# EasyEDA Pro project H7MS-H735-R4B-final-20261017.epro, schematic H7MS_CORE_H735_A1_核心板原理图, sheet 11 of 11

## Sheets
11 C10_XT30宽压输入与5V电源: Board Name: CORE_H735核心板; Create Date: 2026-10-17; Schematic Name: H7MS_CORE_H735_A1_核心板原理图; Update Date: 2026-10-17; Page Size: A4; Version: V1.0
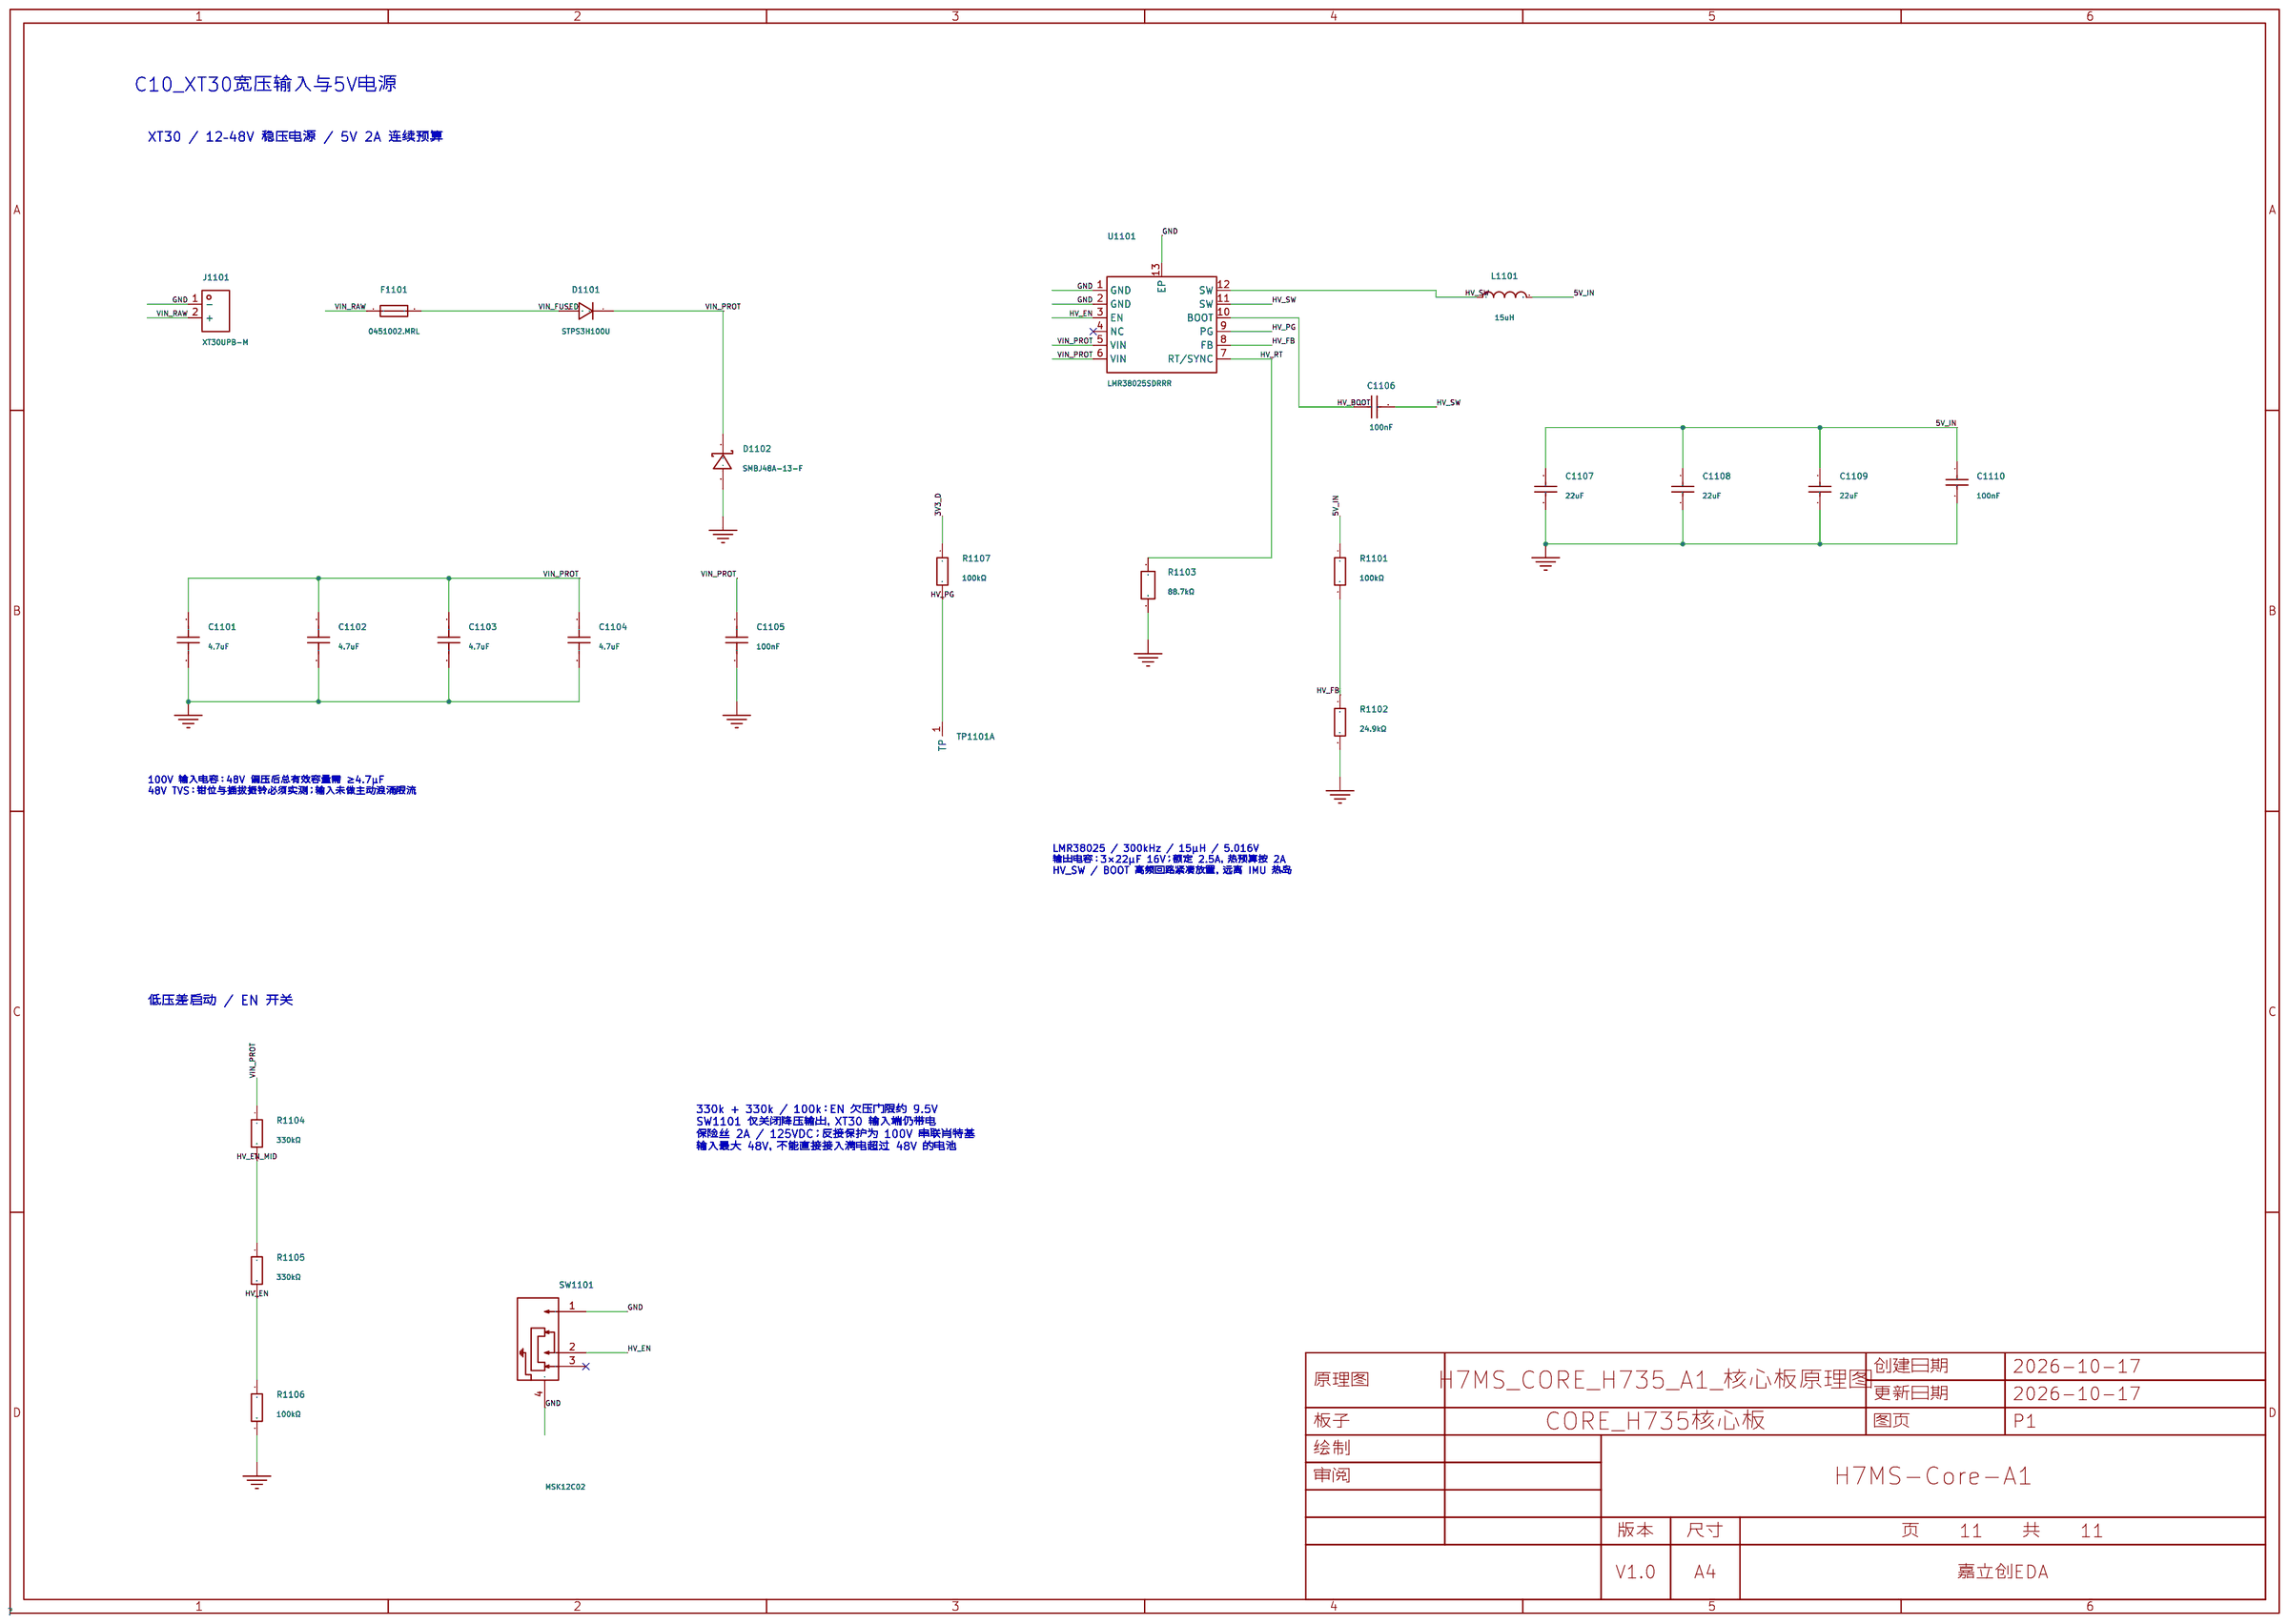
[diagram p10: C10_XT30宽压输入与5V电源]

## Parts
C1101  4.7uF  [C1210]
C1102  4.7uF  [C1210]
C1103  4.7uF  [C1210]
C1104  4.7uF  [C1210]
C1105  100nF  [C0603]
C1106  100nF  [C0402]
C1107  22uF  [C1206]
C1108  22uF  [C1206]
C1109  22uF  [C1206]
C1110  100nF  [C0402]
D1101  STPS3H100U  [SMB_L4.6-W3.6-LS5.3-RD]
D1102  SMBJ48A-13-F  [SMB_L4.6-W3.6-LS5.3-RD]
F1101  0451002.MRL  [FUSE-SMD_L6.1-W2.7_0451002.MRL]
J1101  XT30UPB-M  [H7MS_XT30UPB_M_Drill1p90]
L1101  15uH  [IND-SMD_L6.6-W6.4_XAL6060-103ME]
R1101  100kΩ  [R0402]
R1102  24.9kΩ  [R0402]
R1103  88.7kΩ  [R0402]
R1104  330kΩ  [R0402]
R1105  330kΩ  [R0402]
R1106  100kΩ  [R0402]
R1107  100kΩ  [R0402]
SW1101  MSK12C02  [SW-TH_MSK12C02]
TP1101  -  [H7MS_TP_0p8_NOMASKPASTE]  (section 1)
U1101  LMR38025SDRRR  [WSON-12_L3.0-W3.0-P0.50-TL-EP-2]

## Library data of the parts
C1101 = GRM32ER72A475KE14L: 容值:4.7uF;精度:±10%;额定电压:100V;温度系数:X7R;; LCSC Part Name: 4.7uF ±10% 100V; Supplier Part: C162515; Manufacturer: muRata(村田); Supplier Footprint: 1210; JLCPCB Part Class: Extended Part; Datasheet: https://item.szlcsc.com/datasheet/GRM32ER72A475KE14L/173896.html; Supplier: LCSC; Tolerance: ±10%; Voltage Rating: 100V; Temperature Coefficient: X7R; H7MS_Function: C_HV_IN1; H7MS_Revision: R4; H7MS_Assembly: FIT
C1102 = GRM32ER72A475KE14L: 容值:4.7uF;精度:±10%;额定电压:100V;温度系数:X7R;; LCSC Part Name: 4.7uF ±10% 100V; Supplier Part: C162515; Manufacturer: muRata(村田); Supplier Footprint: 1210; JLCPCB Part Class: Extended Part; Datasheet: https://item.szlcsc.com/datasheet/GRM32ER72A475KE14L/173896.html; Supplier: LCSC; Tolerance: ±10%; Voltage Rating: 100V; Temperature Coefficient: X7R; H7MS_Function: C_HV_IN2; H7MS_Revision: R4; H7MS_Assembly: FIT
C1103 = GRM32ER72A475KE14L: 容值:4.7uF;精度:±10%;额定电压:100V;温度系数:X7R;; LCSC Part Name: 4.7uF ±10% 100V; Supplier Part: C162515; Manufacturer: muRata(村田); Supplier Footprint: 1210; JLCPCB Part Class: Extended Part; Datasheet: https://item.szlcsc.com/datasheet/GRM32ER72A475KE14L/173896.html; Supplier: LCSC; Tolerance: ±10%; Voltage Rating: 100V; Temperature Coefficient: X7R; H7MS_Function: C_HV_IN3; H7MS_Revision: R4; H7MS_Assembly: FIT
C1104 = GRM32ER72A475KE14L: 容值:4.7uF;精度:±10%;额定电压:100V;温度系数:X7R;; LCSC Part Name: 4.7uF ±10% 100V; Supplier Part: C162515; Manufacturer: muRata(村田); Supplier Footprint: 1210; JLCPCB Part Class: Extended Part; Datasheet: https://item.szlcsc.com/datasheet/GRM32ER72A475KE14L/173896.html; Supplier: LCSC; Tolerance: ±10%; Voltage Rating: 100V; Temperature Coefficient: X7R; H7MS_Function: C_HV_IN4; H7MS_Revision: R4; H7MS_Assembly: FIT
C1105 = GRM188R72A104KA35D: 容值:100nF;精度:±10%;额定电压:100V;温度系数:X7R;; LCSC Part Name: 100nF ±10% 100V; Supplier Part: C77058; Manufacturer: muRata(村田); Supplier Footprint: 0603; JLCPCB Part Class: Extended Part; Datasheet: https://item.szlcsc.com/datasheet/GRM188R72A104KA35D/78185.html; Supplier: LCSC; Tolerance: ±10%; Voltage Rating: 100V; Temperature Coefficient: X7R; H7MS_Function: C_HV_HF; H7MS_Revision: R4; H7MS_Assembly: FIT
C1106 = C1005X7R1H104K050BB: 容值:100nF;精度:±10%;额定电压:50V;温度系数:X7R;; LCSC Part Name: 100nF ±10% 50V; Supplier Part: C2181015; Manufacturer: TDK; Supplier Footprint: 0402; JLCPCB Part Class: Extended Part; Datasheet: https://item.szlcsc.com/datasheet/C1005X7R1H104K050BB/2273082.html; Supplier: LCSC; Tolerance: ±10%; Voltage Rating: 50V; Temperature Coefficient: X7R; H7MS_Function: C_HV_BOOT; H7MS_Revision: R4; H7MS_Assembly: FIT
C1107 = GRM31CR61C226KE15L: 容值:22uF;精度:±10%;额定电压:16V;温度系数:X5R;; LCSC Part Name: 22uF ±10% 16V 停产; Supplier Part: C77088; Manufacturer: muRata(村田); Supplier Footprint: 1206; JLCPCB Part Class: Extended Part; Datasheet: https://item.szlcsc.com/datasheet/GRM31CR61C226KE15L/78215.html; Supplier: LCSC; Tolerance: ±10%; Voltage Rating: 16V; Temperature Coefficient: X5R; H7MS_Function: C_HV_OUT1; H7MS_Revision: R4; H7MS_Assembly: FIT
C1108 = GRM31CR61C226KE15L: 容值:22uF;精度:±10%;额定电压:16V;温度系数:X5R;; LCSC Part Name: 22uF ±10% 16V 停产; Supplier Part: C77088; Manufacturer: muRata(村田); Supplier Footprint: 1206; JLCPCB Part Class: Extended Part; Datasheet: https://item.szlcsc.com/datasheet/GRM31CR61C226KE15L/78215.html; Supplier: LCSC; Tolerance: ±10%; Voltage Rating: 16V; Temperature Coefficient: X5R; H7MS_Function: C_HV_OUT2; H7MS_Revision: R4; H7MS_Assembly: FIT
C1109 = GRM31CR61C226KE15L: 容值:22uF;精度:±10%;额定电压:16V;温度系数:X5R;; LCSC Part Name: 22uF ±10% 16V 停产; Supplier Part: C77088; Manufacturer: muRata(村田); Supplier Footprint: 1206; JLCPCB Part Class: Extended Part; Datasheet: https://item.szlcsc.com/datasheet/GRM31CR61C226KE15L/78215.html; Supplier: LCSC; Tolerance: ±10%; Voltage Rating: 16V; Temperature Coefficient: X5R; H7MS_Function: C_HV_OUT3; H7MS_Revision: R4; H7MS_Assembly: FIT
C1110 = C1005X7R1H104K050BB: 容值:100nF;精度:±10%;额定电压:50V;温度系数:X7R;; LCSC Part Name: 100nF ±10% 50V; Supplier Part: C2181015; Manufacturer: TDK; Supplier Footprint: 0402; JLCPCB Part Class: Extended Part; Datasheet: https://item.szlcsc.com/datasheet/C1005X7R1H104K050BB/2273082.html; Supplier: LCSC; Tolerance: ±10%; Voltage Rating: 50V; Temperature Coefficient: X7R; H7MS_Function: C_HV_OUT_HF; H7MS_Revision: R4; H7MS_Assembly: FIT
D1101 = STPS3H100U: 二极管配置:1个独立式;正向压降(Vf):840mV@3A;直流反向耐压(Vr):100V;整流电流:3A;; LCSC Part Name: 电压:100V 电流:3A; Supplier Part: C283521; Manufacturer: ST(意法半导体); Supplier Footprint: SMB; JLCPCB Part Class: Extended Part; Datasheet: https://item.szlcsc.com/datasheet/STPS3H100U/269331.html; Supplier: LCSC; Diode Configuration: 1个独立式; Voltage - Forward(Vf@If): 840mV@3A; Voltage - DC Reverse(Vr): 100V; Current - Rectified: 3A; Reverse Leakage Current (Ir): 1uA@100V; Non-Repetitive Peak Forward Surge Current: 75A; H7MS_Function: D_REVERSE; H7MS_Revision: R4; H7MS_Assembly: FIT
D1102 = SMBJ48A-13-F: 极性:单向;反向截止电压(Vrwm):48V;钳位电压:77.4V;峰值脉冲电流(Ipp):7.7A@8/20us;峰值脉冲功率(Ppp):600W;击穿电压(VBR):61.3V;; LCSC Part Name: 单向TVS 48V截止 峰值浪涌电流：7.7A@8/20us; Supplier Part: C135078; Manufacturer: DIODES(美台); Supplier Footprint: SMB; JLCPCB Part Class: Extended Part; Datasheet: https://item.szlcsc.com/datasheet/SMBJ48A-13-F/146388.html; Supplier: LCSC; Polarity: 单向; Reverse Stand-Off Voltage (Vrwm): 48V; Clamping Voltage: 77.4V; Peak Pulse Current (Ipp): 7.7A@8/20us; Peak Pulse Power Dissipation (Ppp): 600W; Voltage - Breakdown: 61.3V; Reverse Leakage Current (Ir): 5uA; Number of Channels: 单路; Operating Temperature: -55℃~+150℃; Type: TVS; H7MS_Function: D_INPUT_TVS; H7MS_Revision: R4; H7MS_Assembly: FIT
F1101 = 0451002.MRL: 类型:贴片式保险丝;额定电流:2A;额定电压:125V;分断能力:50A;; LCSC Part Name: 125V贴片式保险丝; Supplier Part: C99547; Manufacturer: Littelfuse(美国力特); Supplier Footprint: 2410; JLCPCB Part Class: Extended Part; Datasheet: https://item.szlcsc.com/datasheet/0451002.MRL/100761.html; Supplier: LCSC; Type: 贴片式保险丝; Current Rating: 2A; Voltage Rating (DC): 125V; Operating Temperature: -55℃~+125℃; Melting I2t: 0.53; Interrupt Rating: 50A; Length: 6.1mm; Width: 2.5mm; H7MS_Function: F_INPUT; H7MS_Revision: R4; H7MS_Assembly: FIT
J1101 = H7MS_XT30UPB_M_Drill1p90: Official copper diameter 2.50 mm and 5.00 mm pitch retained; drill 1.80 -> 1.90 mm. Straight body/silk edges retained; decorative arcs omitted. No PTH stencil openings.; Manufacturer: AMASS(艾迈斯); Supplier: LCSC; Supplier Part: C428721; LCSC Part Name: AMASS(艾迈斯)板载立式 航模锂电池控制器连接器插头 PCB板立式 公头XT30UPB-M.G.Y; JLCPCB Part Class: Extended Part; Datasheet: https://item.szlcsc.com/datasheet/XT30UPB-M/423831.html; Rated current: 15A; Rated voltage: 500VDC; colour: 黄色; Connector type: 航模插头; contact resistance: 0.65mΩ; interface form: 公头; insulating material: PA; metal material: 镀金; H7MS_Function: J_XT30; H7MS_Revision: R4; H7MS_Assembly: FIT
L1101 = XAL6060-153MEC: 电感值:15uH;精度:±20%;额定电流:4.5A;饱和电流(Isat):5.8A;; LCSC Part Name: AEC-Q200; Supplier Part: C19191628; Manufacturer: Coilcraft(线艺); Supplier Footprint: SMD,6.5x6.3mm; JLCPCB Part Class: Extended Part; Datasheet: https://www.coilcraft.com/getmedia/ea51f14b-7f32-4dc6-8dfe-d4b70549040f/xal60xx.pdf; Supplier: LCSC; Tolerance: ±20%; Current Rating: 4.5A; Current - Saturation(Isat): 5.8A; DC Resistance(DCR): 39.77mΩ; H7MS_Function: L_HV; H7MS_Revision: R4; H7MS_Assembly: FIT
R1101 = RC0402FR-07100KL: 电阻类型:厚膜电阻;阻值:100kΩ;精度:±1%;功率:62.5mW;工作电压:50V;温度系数:±100ppm/℃;; LCSC Part Name: 厚膜电阻 100kΩ ±1% 62.5mW; Supplier Part: C60491; Manufacturer: YAGEO(国巨); Supplier Footprint: 0402; JLCPCB Part Class: Extended Part; Datasheet: https://item.szlcsc.com/datasheet/RC0402FR-07100KL/61543.html; Supplier: LCSC; Type: 厚膜电阻; Tolerance: ±1%; Power(Watts): 62.5mW; Voltage-Supply(Max): 50V; Temperature Coefficient: ±100ppm/℃; Operating Temperature: -55℃~+155℃; H7MS_Function: R_HV_FB_TOP; H7MS_Revision: R4; H7MS_Assembly: FIT
R1102 = RC0402FR-0724K9L: 电阻类型:厚膜电阻;阻值:24.9kΩ;精度:±1%;功率:62.5mW;工作电压:50V;温度系数:±100ppm/℃;; LCSC Part Name: 厚膜电阻 24.9kΩ ±1% 62.5mW; Supplier Part: C138027; Manufacturer: YAGEO(国巨); Supplier Footprint: 0402; JLCPCB Part Class: Extended Part; Datasheet: https://item.szlcsc.com/datasheet/RC0402FR-0724K9L/149343.html; Supplier: LCSC; Type: 厚膜电阻; Tolerance: ±1%; Power(Watts): 62.5mW; Voltage-Supply(Max): 50V; Temperature Coefficient: ±100ppm/℃; Operating Temperature: -55℃~+155℃; H7MS_Function: R_HV_FB_BOT; H7MS_Revision: R4; H7MS_Assembly: FIT
R1103 = RC0402FR-0788K7L: 电阻类型:厚膜电阻;阻值:88.7kΩ;精度:±1%;功率:62.5mW;最大工作电压:50V;温度系数:±100ppm/℃;; LCSC Part Name: 厚膜电阻 88.7kΩ ±1% 62.5mW; Supplier Part: C477808; Manufacturer: YAGEO(国巨); Supplier Footprint: 0402; JLCPCB Part Class: Extended Part; Datasheet: https://atta.szlcsc.com/upload/public/pdf/source/20200715/C477808_E93B983CCCA2234B6CC6C85034F2A362.pdf; Supplier: LCSC; Type: 厚膜电阻; Tolerance: ±1%; Power(Watts): 62.5mW; Overload Voltage (Max): 50V; Temperature Coefficient: ±100ppm/℃; Operating Temperature Range: -55℃~+155℃; H7MS_Function: R_HV_RT; H7MS_Revision: R4; H7MS_Assembly: FIT
R1104 = RC0402FR-07330KL: 电阻类型:厚膜电阻;阻值:330kΩ;精度:±1%;功率:62.5mW;工作电压:50V;温度系数:±100ppm/℃;; LCSC Part Name: 厚膜电阻 330kΩ ±1% 62.5mW; Supplier Part: C138006; Manufacturer: YAGEO(国巨); Supplier Footprint: 0402; JLCPCB Part Class: Extended Part; Datasheet: https://item.szlcsc.com/datasheet/RC0402FR-07330KL/149322.html; Supplier: LCSC; Type: 厚膜电阻; Tolerance: ±1%; Power(Watts): 62.5mW; Voltage-Supply(Max): 50V; Temperature Coefficient: ±100ppm/℃; Operating Temperature: -55℃~+155℃; H7MS_Function: R_HV_EN_TOP1; H7MS_Revision: R4; H7MS_Assembly: FIT
R1105 = RC0402FR-07330KL: 电阻类型:厚膜电阻;阻值:330kΩ;精度:±1%;功率:62.5mW;工作电压:50V;温度系数:±100ppm/℃;; LCSC Part Name: 厚膜电阻 330kΩ ±1% 62.5mW; Supplier Part: C138006; Manufacturer: YAGEO(国巨); Supplier Footprint: 0402; JLCPCB Part Class: Extended Part; Datasheet: https://item.szlcsc.com/datasheet/RC0402FR-07330KL/149322.html; Supplier: LCSC; Type: 厚膜电阻; Tolerance: ±1%; Power(Watts): 62.5mW; Voltage-Supply(Max): 50V; Temperature Coefficient: ±100ppm/℃; Operating Temperature: -55℃~+155℃; H7MS_Function: R_HV_EN_TOP2; H7MS_Revision: R4; H7MS_Assembly: FIT
R1106 = RC0402FR-07100KL: 电阻类型:厚膜电阻;阻值:100kΩ;精度:±1%;功率:62.5mW;工作电压:50V;温度系数:±100ppm/℃;; LCSC Part Name: 厚膜电阻 100kΩ ±1% 62.5mW; Supplier Part: C60491; Manufacturer: YAGEO(国巨); Supplier Footprint: 0402; JLCPCB Part Class: Extended Part; Datasheet: https://item.szlcsc.com/datasheet/RC0402FR-07100KL/61543.html; Supplier: LCSC; Type: 厚膜电阻; Tolerance: ±1%; Power(Watts): 62.5mW; Voltage-Supply(Max): 50V; Temperature Coefficient: ±100ppm/℃; Operating Temperature: -55℃~+155℃; H7MS_Function: R_HV_EN_BOT; H7MS_Revision: R4; H7MS_Assembly: FIT
R1107 = RC0402FR-07100KL: 电阻类型:厚膜电阻;阻值:100kΩ;精度:±1%;功率:62.5mW;工作电压:50V;温度系数:±100ppm/℃;; LCSC Part Name: 厚膜电阻 100kΩ ±1% 62.5mW; Supplier Part: C60491; Manufacturer: YAGEO(国巨); Supplier Footprint: 0402; JLCPCB Part Class: Extended Part; Datasheet: https://item.szlcsc.com/datasheet/RC0402FR-07100KL/61543.html; Supplier: LCSC; Type: 厚膜电阻; Tolerance: ±1%; Power(Watts): 62.5mW; Voltage-Supply(Max): 50V; Temperature Coefficient: ±100ppm/℃; Operating Temperature: -55℃~+155℃; H7MS_Function: R_HV_PG; H7MS_Revision: R4; H7MS_Assembly: FIT
SW1101 = MSK12C02: 电路结构:单刀双掷;安装方式:卧贴;开关颜色:-;额定电流:50mA;额定电压:12V;工作寿命:1万次;; LCSC Part Name: MSK12C02 白柄1.5编带; Supplier Part: C431540; Manufacturer: SHOU HAN(首韩); Supplier Footprint: SMD,8x2.8mm; JLCPCB Part Class: Extended Part; Datasheet: https://item.szlcsc.com/datasheet/MSK12C02/427897.html; Supplier: LCSC; Circuit: 单刀双掷; Termination Style: SMD接片; Length: 8mm; Width: 2.8mm; Switch Height: 1.4mm; Mounting Type: 卧贴; Current Rating: 50mA; Voltage Rating: 12V; Life: 1万次; Operating Temperature: -20℃~+70℃; H7MS_Function: SW_POWER_EN; H7MS_Revision: R4; H7MS_Assembly: FIT
TP1101 = H7MS_PCB_TP_0.8: PCB copper feature, no purchased part; Manufacturer Part: PCB_TP_0.8; H7MS_Function: TP_HV_PG; H7MS_Revision: R4; H7MS_Assembly: FIT
U1101 = LMR38025SDRRR: 功能类型:降压型;工作电压:4.2V~80V;输出电压:1V~75V;输出电流:2.5A;输出类型:可调;; LCSC Part Name: 降压型 2.5A 4.2V~80V; Supplier Part: C22405313; Manufacturer: TI(德州仪器); Supplier Footprint: WSON-12-EP(3x3); JLCPCB Part Class: Extended Part; Datasheet: https://www.ti.com.cn/cn/lit/ds/symlink/lmr38025.pdf; Supplier: LCSC; Function: 降压型; Voltage - Supply: 4.2V~80V; Output Voltage: 1V~75V; Output Current: 2.5A; Frequency - Switching: 200kHz~2.2MHz; Operating Temperature: -40℃~+150℃@(TJ); Synchronous Rectifier: 是; Number of Outputs: 1; Topology: 降压式; Quiescent Current: 40uA; Switch tube (built-in/external): 内置; Output Type: 可调; Features: 轻载高效模式；频率同步；逐波限流；过流保护；EMI优化(抖频模式)；工作状态指示；打嗝限流; H7MS_Function: U_HV; H7MS_Revision: R4; H7MS_Assembly: FIT

## Nets
3V3_D: R1107.1 ; also on sheet 1 2 3 4 5 6 7 8 10
5V_IN: C1107.1 C1108.1 C1109.1 C1110.1 L1101.2 R1101.1 ; also on sheet 3 5 6 8 10
GND: C1101.2 C1102.2 C1103.2 C1104.2 C1105.2 C1107.2 C1108.2 C1109.2 C1110.2 D1102.2(A) J1101.1(-) R1102.2 R1103.2 R1106.2 SW1101.1 SW1101.4 U1101.1(GND) U1101.2(GND) U1101.13(EP) ; also on sheet 1 2 3 4 5 6 7 8 9 10
VIN_FUSED: D1101.2(A) F1101.2
VIN_PROT: C1101.1 C1102.1 C1103.1 C1104.1 C1105.1 D1101.1(K) D1102.1(K) R1104.1 U1101.5(VIN) U1101.6(VIN)
VIN_RAW: F1101.1 J1101.2(+)
HV_BOOT: C1106.1 U1101.10(BOOT)
HV_EN: R1105.2 R1106.1 SW1101.2 U1101.3(EN)
HV_EN_MID: R1104.2 R1105.1
HV_FB: R1101.2 R1102.1 U1101.8(FB)
HV_PG: R1107.2 TP1101.1(TP) U1101.9(PG)
HV_RT: R1103.1 U1101.7(RT/SYNC)
HV_SW: C1106.2 L1101.1 U1101.11(SW) U1101.12(SW)

Not connected (* = marked no-connect by the designer): SW1101 3*; U1101 4(NC)*

## Notes on the sheets
sheet 11
- C10_XT30宽压输入与5V电源
- C10_XT30宽压输入与5V电源
- C10_XT30宽压输入与5V电源
- C10_XT30宽压输入与5V电源
- C10_XT30宽压输入与5V电源
- C10_XT30宽压输入与5V电源
- XT30 / 12–48V 稳压电源 / 5V 2A 连续预算
- XT30 / 12–48V 稳压电源 / 5V 2A 连续预算
- XT30 / 12–48V 稳压电源 / 5V 2A 连续预算
- XT30 / 12–48V 稳压电源 / 5V 2A 连续预算
- XT30 / 12–48V 稳压电源 / 5V 2A 连续预算
- XT30 / 12–48V 稳压电源 / 5V 2A 连续预算
- 100V 输入电容：48V 偏压后总有效容量需 ≥4.7µF
  48V TVS：钳位与插拔振铃必须实测；输入未做主动浪涌限流
- 100V 输入电容：48V 偏压后总有效容量需 ≥4.7µF
  48V TVS：钳位与插拔振铃必须实测；输入未做主动浪涌限流
- 100V 输入电容：48V 偏压后总有效容量需 ≥4.7µF
  48V TVS：钳位与插拔振铃必须实测；输入未做主动浪涌限流
- 100V 输入电容：48V 偏压后总有效容量需 ≥4.7µF
  48V TVS：钳位与插拔振铃必须实测；输入未做主动浪涌限流
- 100V 输入电容：48V 偏压后总有效容量需 ≥4.7µF
  48V TVS：钳位与插拔振铃必须实测；输入未做主动浪涌限流
- 100V 输入电容：48V 偏压后总有效容量需 ≥4.7µF
  48V TVS：钳位与插拔振铃必须实测；输入未做主动浪涌限流
- LMR38025 / 300kHz / 15µH / 5.016V
  输出电容：3×22µF 16V；额定 2.5A，热预算按 2A
  HV_SW / BOOT 高频回路紧凑放置，远离 IMU 热岛
- LMR38025 / 300kHz / 15µH / 5.016V
  输出电容：3×22µF 16V；额定 2.5A，热预算按 2A
  HV_SW / BOOT 高频回路紧凑放置，远离 IMU 热岛
- LMR38025 / 300kHz / 15µH / 5.016V
  输出电容：3×22µF 16V；额定 2.5A，热预算按 2A
  HV_SW / BOOT 高频回路紧凑放置，远离 IMU 热岛
- LMR38025 / 300kHz / 15µH / 5.016V
  输出电容：3×22µF 16V；额定 2.5A，热预算按 2A
  HV_SW / BOOT 高频回路紧凑放置，远离 IMU 热岛
- LMR38025 / 300kHz / 15µH / 5.016V
  输出电容：3×22µF 16V；额定 2.5A，热预算按 2A
  HV_SW / BOOT 高频回路紧凑放置，远离 IMU 热岛
- LMR38025 / 300kHz / 15µH / 5.016V
  输出电容：3×22µF 16V；额定 2.5A，热预算按 2A
  HV_SW / BOOT 高频回路紧凑放置，远离 IMU 热岛
- 低压差启动 / EN 开关
- 低压差启动 / EN 开关
- 低压差启动 / EN 开关
- 低压差启动 / EN 开关
- 低压差启动 / EN 开关
- 低压差启动 / EN 开关
- 330k + 330k / 100k：EN 欠压门限约 9.5V
  SW1101 仅关闭降压输出，XT30 输入端仍带电
  保险丝 2A / 125VDC；反接保护为 100V 串联肖特基
  输入最大 48V，不能直接接入满电超过 48V 的电池
- 330k + 330k / 100k：EN 欠压门限约 9.5V
  SW1101 仅关闭降压输出，XT30 输入端仍带电
  保险丝 2A / 125VDC；反接保护为 100V 串联肖特基
  输入最大 48V，不能直接接入满电超过 48V 的电池
- 330k + 330k / 100k：EN 欠压门限约 9.5V
  SW1101 仅关闭降压输出，XT30 输入端仍带电
  保险丝 2A / 125VDC；反接保护为 100V 串联肖特基
  输入最大 48V，不能直接接入满电超过 48V 的电池
- 330k + 330k / 100k：EN 欠压门限约 9.5V
  SW1101 仅关闭降压输出，XT30 输入端仍带电
  保险丝 2A / 125VDC；反接保护为 100V 串联肖特基
  输入最大 48V，不能直接接入满电超过 48V 的电池
- 330k + 330k / 100k：EN 欠压门限约 9.5V
  SW1101 仅关闭降压输出，XT30 输入端仍带电
  保险丝 2A / 125VDC；反接保护为 100V 串联肖特基
  输入最大 48V，不能直接接入满电超过 48V 的电池
- 330k + 330k / 100k：EN 欠压门限约 9.5V
  SW1101 仅关闭降压输出，XT30 输入端仍带电
  保险丝 2A / 125VDC；反接保护为 100V 串联肖特基
  输入最大 48V，不能直接接入满电超过 48V 的电池
